# Altium project Camera-Controller-Board.PrjPcb (part 18 of 18)

## Sheet CCB-MB-Interface.SchDoc
size 420 x 297 mm; SheetNumber: 22; SheetTotal: 22
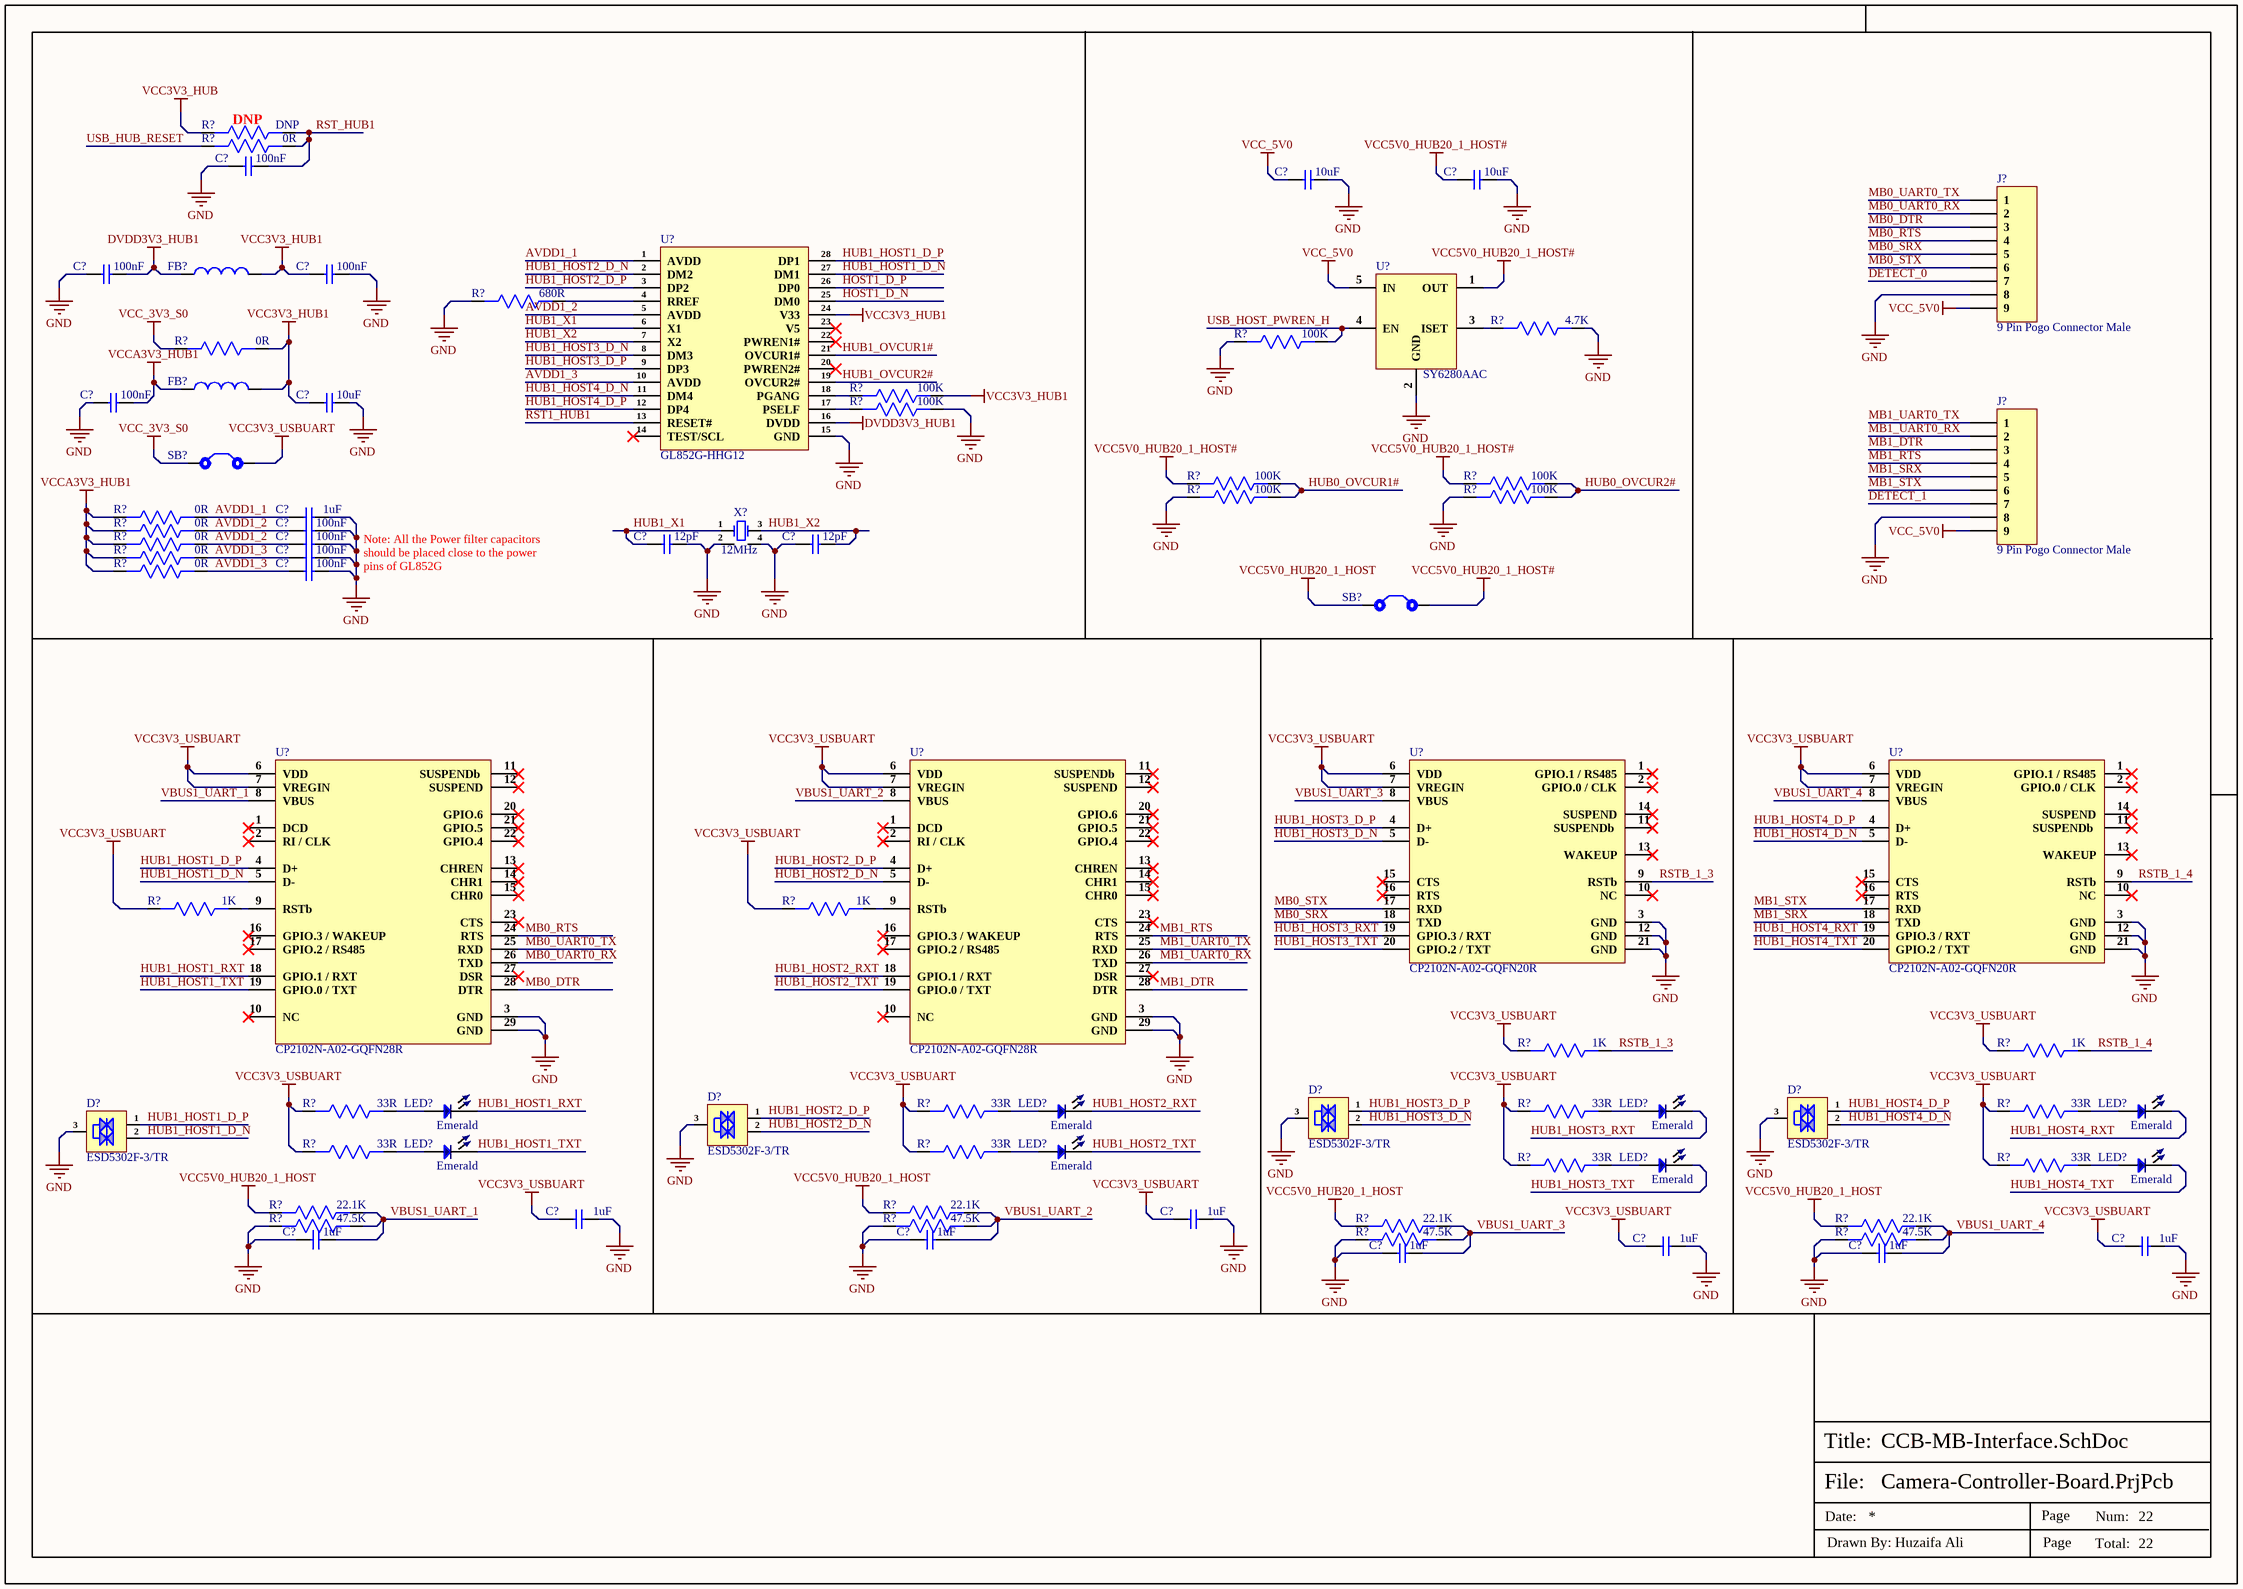
[diagram p21: CCB-MB-Interface.SchDoc]

### Parts
(Parts that share a designator on the sheet are numbered #1, #2 ... from top to bottom, then left to right.)
C?#27  100nF  [Cap-0402]
C?#28  10uF  [Cap-0603]
C?#29  10uF  [Cap-0603]
C?#30  100nF  [Cap-0402]
C?#31  100nF  [Cap-0402]
C?#32  100nF  [Cap-0402]
C?#33  10uF  [Cap-0603]
C?#34  1uF  [Cap-0603]
C?#35  100nF  [Cap-0402]
C?#36  100nF  [Cap-0402]
C?#37  12pF  [Cap-0402]
C?#38  12pF  [Cap-0402]
C?#39  100nF  [Cap-0402]
C?#40  100nF  [Cap-0402]
C?#41  1uF  [Cap-0603]
C?#42  1uF  [Cap-0603]
C?#43  1uF  [Cap-0603]
C?#44  1uF  [Cap-0603]
C?#45  1uF  [Cap-0603]
C?#46  1uF  [Cap-0603]
C?#47  1uF  [Cap-0603]
C?#48  1uF  [Cap-0603]
D?#10  ESD5302F-3/TR  [Sot-23]
D?#11  ESD5302F-3/TR  [Sot-23]
D?#12  ESD5302F-3/TR  [Sot-23]
D?#13  ESD5302F-3/TR  [Sot-23]
FB?#4  BLM15PD121SN1D  [IND-0402]  (value not drawn)
FB?#5  120R  [IND-0603 (1608 Metric)]  (value not drawn)
J?#4  9 Pin Pogo Connector Male  [MG0922M-RA]
J?#5  9 Pin Pogo Connector Male  [MG0922M-RA]
LED?#9  Emerald  [LED-0603]
LED?#10  Emerald  [LED-0603]
LED?#11  Emerald  [LED-0603]
LED?#12  Emerald  [LED-0603]
LED?#13  Emerald  [LED-0603]
LED?#14  Emerald  [LED-0603]
LED?#15  Emerald  [LED-0603]
LED?#16  Emerald  [LED-0603]
R?#41  DNP  [Res-0402]
R?#42  0R  [Res-0402]
R?#43  680R  [Res-0603]
R?#44  4.7K  [Res-0402]
R?#45  100K  [Res-0402]
R?#46  0R  [Res-0603]
R?#47  100K  [Res-0402]
R?#48  100K  [Res-0402]
R?#49  100K  [Res-0402]
R?#50  100K  [Res-0402]
R?#51  100K  [Res-0402]
R?#52  100K  [Res-0402]
R?#53  0R  [Res-0402]
R?#54  0R  [Res-0402]
R?#55  0R  [Res-0402]
R?#56  0R  [Res-0402]
R?#57  0R  [Res-0402]
R?#58  1K  [Res-0402]
R?#59  1K  [Res-0402]
R?#60  1K  [Res-0402]
R?#61  1K  [Res-0402]
R?#62  33R  [Res-0402]
R?#63  33R  [Res-0402]
R?#64  33R  [Res-0402]
R?#65  33R  [Res-0402]
R?#66  33R  [Res-0402]
R?#67  33R  [Res-0402]
R?#68  33R  [Res-0402]
R?#69  33R  [Res-0402]
R?#70  22.1K  [Res-0603]
R?#71  22.1K  [Res-0603]
R?#72  47.5K  [Res-0603]
R?#73  47.5K  [Res-0603]
R?#74  22.1K  [Res-0603]
R?#75  22.1K  [Res-0603]
R?#76  47.5K  [Res-0603]
R?#77  47.5K  [Res-0603]
SB?#12  Solder Bridge 0603  [Solder Bridge]  (value not drawn)
SB?#13  Solder Bridge 0603  [Solder Bridge]  (value not drawn)
U?#13  GL852G-HHG12  [SSOP-28-208mil]
U?#14  SY6280AAC  [SOT-23-5]
U?#15  CP2102N-A02-GQFN28R  [28-QFN (5x5)_]
U?#16  CP2102N-A02-GQFN28R  [28-QFN (5x5)_]
U?#17  CP2102N-A02-GQFN20R  [20-QFN (3x3)]
U?#18  CP2102N-A02-GQFN20R  [20-QFN (3x3)]
X?#2  12MHz  [X322512MOB4SI_]

### Nets
DVDD3V3_HUB1: C?#30.2 FB?#4.1 U?#13.16(DVDD)
GND: C?#27.1 C?#28.2 C?#29.2 C?#30.1 C?#31.2 C?#32.1 C?#33.2 C?#34.2 C?#35.2 C?#36.2 C?#37.2 C?#38.1 C?#39.2 C?#40.2 C?#41.2 C?#42.2 C?#43.1 C?#44.1 C?#45.2 C?#46.2 C?#47.1 C?#48.1 D?#10.3(GND) D?#11.3(GND) D?#12.3(GND) D?#13.3(GND) J?#4.8 J?#5.8 R?#43.2 R?#44.1 R?#45.2 R?#48.1 R?#51.2 R?#52.2 R?#72.2 R?#73.2 R?#76.2 R?#77.2 U?#13.15(GND) U?#14.2(GND) U?#15.3(GND) U?#15.29(GND) U?#16.3(GND) U?#16.29(GND) U?#17.3(GND) U?#17.12(GND) U?#17.21(GND) U?#18.3(GND) U?#18.12(GND) U?#18.21(GND) X?#2.2(GND) X?#2.4(GND)
VCC3V3_HUB: R?#41.2
VCC3V3_HUB1: C?#31.1 C?#33.1 FB?#4.2 FB?#5.2 R?#46.1 R?#47.1 U?#13.24(V33)
VCC3V3_USBUART: C?#41.1 C?#42.1 C?#45.1 C?#46.1 R?#58.2 R?#59.2 R?#60.2 R?#61.2 R?#62.2 R?#63.2 R?#64.2 R?#65.2 R?#66.2 R?#67.2 R?#68.2 R?#69.2 SB?#12.2 U?#15.6(VDD) U?#15.7(VREGIN) U?#16.6(VDD) U?#16.7(VREGIN) U?#17.6(VDD) U?#17.7(VREGIN) U?#18.6(VDD) U?#18.7(VREGIN)
VCC5V0_HUB20_1_HOST: R?#70.2 R?#71.2 R?#74.2 R?#75.2 SB?#13.1
VCC5V0_HUB20_1_HOST#: C?#29.1 R?#49.2 R?#50.2 SB?#13.2 U?#14.1(OUT)
VCC_3V3_S0: R?#46.2 SB?#12.1
VCC_5V0: C?#28.1 J?#4.9 J?#5.9 U?#14.5(IN)
VCCA3V3_HUB1: C?#32.2 FB?#5.1 R?#53.2 R?#54.2 R?#55.2 R?#56.2 R?#57.2
AVDD1_1: C?#34.1 R?#53.1 U?#13.1(AVDD)
AVDD1_2: C?#35.1 C?#36.1 R?#54.1 R?#55.1 U?#13.5(AVDD)
AVDD1_3: C?#39.1 C?#40.1 R?#56.1 R?#57.1 U?#13.10(AVDD)
DETECT_0: J?#4.7
DETECT_1: J?#5.7
HOST1_D_N: U?#13.25(DM0)
HOST1_D_P: U?#13.26(DP0)
HUB0_OVCUR1#: R?#49.1 R?#51.1
HUB0_OVCUR2#: R?#50.1 R?#52.1
HUB1_HOST1_D_N: D?#13.2(I/O2) U?#13.27(DM1) U?#15.5(D-)
HUB1_HOST1_D_P: D?#13.1(I/O1) U?#13.28(DP1) U?#15.4(D+)
HUB1_HOST1_RXT: LED?#9.2 U?#15.18(GPIO.1_/_RXT)
HUB1_HOST1_TXT: LED?#13.2 U?#15.19(GPIO.0_/_TXT)
HUB1_HOST2_D_N: D?#12.2(I/O2) U?#13.2(DM2) U?#16.5(D-)
HUB1_HOST2_D_P: D?#12.1(I/O1) U?#13.3(DP2) U?#16.4(D+)
HUB1_HOST2_RXT: LED?#10.2 U?#16.18(GPIO.1_/_RXT)
HUB1_HOST2_TXT: LED?#14.2 U?#16.19(GPIO.0_/_TXT)
HUB1_HOST3_D_N: D?#10.2(I/O2) U?#13.8(DM3) U?#17.5(D-)
HUB1_HOST3_D_P: D?#10.1(I/O1) U?#13.9(DP3) U?#17.4(D+)
HUB1_HOST3_RXT: LED?#11.2 U?#17.19(GPIO.3_/_RXT)
HUB1_HOST3_TXT: LED?#15.2 U?#17.20(GPIO.2_/_TXT)
HUB1_HOST4_D_N: D?#11.2(I/O2) U?#13.11(DM4) U?#18.5(D-)
HUB1_HOST4_D_P: D?#11.1(I/O1) U?#13.12(DP4) U?#18.4(D+)
HUB1_HOST4_RXT: LED?#12.2 U?#18.19(GPIO.3_/_RXT)
HUB1_HOST4_TXT: LED?#16.2 U?#18.20(GPIO.2_/_TXT)
HUB1_OVCUR1#: U?#13.21(OVCUR1#)
HUB1_OVCUR2#: U?#13.19(OVCUR2#)
HUB1_X1: C?#37.1 U?#13.6(X1) X?#2.1
HUB1_X2: C?#38.2 U?#13.7(X2) X?#2.3
MB0_DTR: J?#4.3 U?#15.28(DTR)
MB0_RTS: J?#4.4 U?#15.24(RTS)
MB0_SRX: J?#4.5 U?#17.18(TXD)
MB0_STX: J?#4.6 U?#17.17(RXD)
MB0_UART0_RX: J?#4.2 U?#15.26(TXD)
MB0_UART0_TX: J?#4.1 U?#15.25(RXD)
MB1_DTR: J?#5.3 U?#16.28(DTR)
MB1_RTS: J?#5.4 U?#16.24(RTS)
MB1_SRX: J?#5.5 U?#18.18(TXD)
MB1_STX: J?#5.6 U?#18.17(RXD)
MB1_UART0_RX: J?#5.2 U?#16.26(TXD)
MB1_UART0_TX: J?#5.1 U?#16.25(RXD)
RST1_HUB1: U?#13.13(RESET#)
RST_HUB1: C?#27.2 R?#41.1 R?#42.1
RSTB_1_3: R?#60.1 U?#17.9(RSTb)
RSTB_1_4: R?#61.1 U?#18.9(RSTb)
USB_HOST_PWREN_H: R?#45.1 U?#14.4(EN)
USB_HUB_RESET: R?#42.2
VBUS1_UART_1: C?#43.2 R?#70.1 R?#72.1 U?#15.8(VBUS)
VBUS1_UART_2: C?#44.2 R?#71.1 R?#73.1 U?#16.8(VBUS)
VBUS1_UART_3: C?#47.2 R?#74.1 R?#76.1 U?#17.8(VBUS)
VBUS1_UART_4: C?#48.2 R?#75.1 R?#77.1 U?#18.8(VBUS)
NetLED?#9_1: LED?#9.1 R?#62.1
NetLED?#10_1: LED?#10.1 R?#63.1
NetLED?#11_1: LED?#11.1 R?#64.1
NetLED?#12_1: LED?#12.1 R?#65.1
NetLED?#13_1: LED?#13.1 R?#66.1
NetLED?#14_1: LED?#14.1 R?#67.1
NetLED?#15_1: LED?#15.1 R?#68.1
NetLED?#16_1: LED?#16.1 R?#69.1
NetR?#43_1: R?#43.1 U?#13.4(RREF)
NetR?#44_2: R?#44.2 U?#14.3(ISET)
NetR?#47_2: R?#47.2 U?#13.18(PGANG)
NetR?#48_2: R?#48.2 U?#13.17(PSELF)
NetR?#58_1: R?#58.1 U?#15.9(RSTb)
NetR?#59_1: R?#59.1 U?#16.9(RSTb)

Not connected (* = marked no-connect by the designer): U?#13 14(TEST/SCL)* 20(PWREN2#)* 22(PWREN1#)* 23(V5)*; U?#15 1(DCD)* 2(RI_/_CLK)* 10(NC)* 11(SUSPENDb_)* 12(SUSPEND)* 13(CHREN)* 14(CHR1)* 15(CHR0)* 16(GPIO.3_/_WAKEUP)* 17(GPIO.2_/_RS485)* 20(GPIO.6)* 21(GPIO.5)* 22(GPIO.4)* 23(CTS)* 27(DSR)*; U?#16 1(DCD)* 2(RI_/_CLK)* 10(NC)* 11(SUSPENDb_)* 12(SUSPEND)* 13(CHREN)* 14(CHR1)* 15(CHR0)* 16(GPIO.3_/_WAKEUP)* 17(GPIO.2_/_RS485)* 20(GPIO.6)* 21(GPIO.5)* 22(GPIO.4)* 23(CTS)* 27(DSR)*; U?#17 1(GPIO.1_/_RS485)* 2(GPIO.0_/_CLK)* 10(NC)* 11(SUSPENDb_)* 13(WAKEUP)* 14(SUSPEND)* 15(CTS)* 16(RTS)*; U?#18 1(GPIO.1_/_RS485)* 2(GPIO.0_/_CLK)* 10(NC)* 11(SUSPENDb_)* 13(WAKEUP)* 14(SUSPEND)* 15(CTS)* 16(RTS)*

### Notes on the sheet
- (near R?#41) DNP
- (near C?#39) Note: All the Power filter capacitors should be placed close to the power pins of GL852G
- File:
- Title:
- Date:
- Page
- Num:
- Total:
- Drawn By: Huzaifa Ali

### Library data of the parts
C?#27 C?#30-C?#32 C?#35 C?#36 C?#39 C?#40 = CC0402KRX5R7BB104: as C?#23 on sheet ESP32-Sheet; Supplier 1: Mouser; Manufacturer Part Number: CC0402KRX5R7BB104; RoHS: Yes; Category: Ceramic Capacitors; Stock 1: 936792; Pricing 1: 1=0.10000, 10=0.02300, 50=0.02300, 100=0.01100, 1000=0.00600, 10000=0.00400 (USD); Mount: Surface Mount; Case/Package: 0402; Number of Pins: 2; Case Code (Metric): 1005; Case Code (Imperial): 0402; Min Operating Temperature: -55°C; Max Operating Temperature: 85°C; Capacitance: 100nF; Dielectric: X5R; Packaging: Tape and Reel; Voltage Rating: 16V; Package Quantity: 1; Voltage Rating (DC): 16V; Termination: SMD/SMT; Resistor Type: Ceramic; Series: CC; Construction: Flat; Length: 1mm; Width: 0.02inch; Height: 0.5mm; Thickness: 0.022inch; Depth: 0.5mm; Radiation Hardening: No; REACH SVHC: Unknown; Lead Free: Lead Free; Halogen Free: Halogen Free; RoHS Compliant: Yes; ComponentLink1URL: https://datasheet.ciiva.com/155/mlccorderingcode-155879.pdf?src-supplier=Digi-Key; ComponentLink1Description: https://datasheet.ciiva.com/155/mlccorderingcode-155879.pdf?src-supplier=Digi-Key; ComponentLink2URL: https://datasheet.ciiva.com/155/mlccorderingcode-155878.pdf?src-supplier=Digi-Key; ComponentLink2Description: https://datasheet.ciiva.com/155/mlccorderingcode-155878.pdf?src-supplier=Digi-Key; ComponentLink3URL: https://datasheet.ciiva.com/155/mlccorderingcode-155880.pdf?src-supplier=Digi-Key; ComponentLink3Description: https://datasheet.ciiva.com/155/mlccorderingcode-155880.pdf?src-supplier=Digi-Key; ComponentLink4URL: https://datasheet.ciiva.com/11464/upy-gphc-x5r-4v-to-50v-12-11464869.pdf?src-supplier=Avnet; ComponentLink4Description: https://datasheet.ciiva.com/11464/upy-gphc-x5r-4v-to-50v-12-11464869.pdf?src-supplier=Avnet; Supplier Part Number 1: 603-CC402KRX5R7BB104; LCSC Part Number: C106204
C?#28 C?#29 C?#33 = CC0603KRX5R6BB106: as C?#24 on sheet ESP32-Sheet; Supplier 1: Digi-Key; Manufacturer Part Number: CC0603KRX5R6BB106; RoHS: Yes; Category: Ceramic Capacitors; Stock 1: 187515; Pricing 1: 1=0.24000, 10=0.16300, 50=0.09780, 100=0.08260, 500=0.05654, 1000=0.05001 (USD); Mount: Surface Mount; Case/Package: 0603; Case Code (Metric): 1608; Case Code (Imperial): 0603; Weight: 7.1E-05oz; Min Operating Temperature: -55°C; Max Operating Temperature: 85°C; Capacitance: 10uF; Packaging: Tape and Reel; Dielectric: X5R; Voltage Rating: 10V; Termination: SMD/SMT; Resistor Type: Ceramic; Voltage Rating (DC): 10V; Package Quantity: 4000; Length: 0.063inch; Width: 0.031inch; Thickness: 0.035inch; Depth: 0.8mm; Lead Free: Lead Free; Halogen Free: Halogen Free; RoHS Compliant: Yes; ComponentLink1URL: http://www.mouser.com/ds/2/447/Yageo_UPY-GP_NP0_16V-to-50V_9-358835.pdf?src-supplier=Mouser; ComponentLink1Description: http://www.mouser.com/ds/2/447/Yageo_UPY-GP_NP0_16V-to-50V_9-358835.pdf?src-supplier=Mouser; ComponentLink2URL: http://www.yageo.com/documents/recent/UPY-GPHC_X5R_4V-to-50V_25.pdf?src-supplier=Digi-Key; ComponentLink2Description: http://www.yageo.com/documents/recent/UPY-GPHC_X5R_4V-to-50V_25.pdf?src-supplier=Digi-Key; Supplier Part Number 1: 311-1782-1-ND; LCSC Part Number: C326057
C?#34 C?#41-C?#48 = CC0603KRX5R8BB105: as C?#25 on sheet ESP32-Sheet; Supplier 1: Digi-Key; Manufacturer Part Number: CC0603KRX5R8BB105; RoHS: Yes; Category: Ceramic Capacitors; Stock 1: 919939; Pricing 1: 1=0.12000, 10=0.08400, 50=0.04760, 100=0.03940, 500=0.02764, 1000=0.02288 (USD); Mount: Surface Mount; Case/Package: 0603; Number of Pins: 2; Case Code (Metric): 1608; Case Code (Imperial): 0603; Min Operating Temperature: -55°C; Max Operating Temperature: 85°C; Capacitance: 1uF; Dielectric: X5R; Package Quantity: 1; Voltage Rating: 25V; Packaging: Tape and Reel; Termination: SMD/SMT; Voltage Rating (DC): 25V; Series: CC; Construction: Flat; Length: 1.6mm; Width: 0.031inch; Height: 0.8mm; Thickness: 0.035inch; Depth: 0.8mm; Radiation Hardening: No; REACH SVHC: No SVHC; Lead Free: Lead Free; Halogen Free: Halogen Free; RoHS Compliant: Yes; ComponentLink1URL: https://datasheet.ciiva.com/176/mlccorderingcode-176785.pdf?src-supplier=Digi-Key; ComponentLink1Description: https://datasheet.ciiva.com/176/mlccorderingcode-176785.pdf?src-supplier=Digi-Key; ComponentLink2URL: https://datasheet.ciiva.com/176/mlccorderingcode-176786.pdf?src-supplier=Digi-Key; ComponentLink2Description: https://datasheet.ciiva.com/176/mlccorderingcode-176786.pdf?src-supplier=Digi-Key; ComponentLink3URL: https://datasheet.ciiva.com/176/mlccorderingcode-176787.pdf?src-supplier=Digi-Key; ComponentLink3Description: https://datasheet.ciiva.com/176/mlccorderingcode-176787.pdf?src-supplier=Digi-Key; ComponentLink4URL: https://datasheet.ciiva.com/17436/upy-gphc-x5r-4v-to-50v-12-17436952.pdf?src-supplier=Avnet+Europe; ComponentLink4Description: https://datasheet.ciiva.com/17436/upy-gphc-x5r-4v-to-50v-12-17436952.pdf?src-supplier=Avnet+Europe; ComponentLink5URL: https://datasheet.ciiva.com/7978/1525783-7978171.pdf?src-supplier=Element14; ComponentLink5Description: https://datasheet.ciiva.com/7978/1525783-7978171.pdf?src-supplier=Element14; ComponentLink6URL: https://datasheet.ciiva.com/11586/upy-gphc-x5r-4v-to-50v-12-11586318.pdf?src-supplier=Avnet; ComponentLink6Description: https://datasheet.ciiva.com/11586/upy-gphc-x5r-4v-to-50v-12-11586318.pdf?src-supplier=Avnet; Supplier Part Number 1: 311-1445-1-ND; LCSC Part Number: C14664
C?#37 C?#38 = GJM1555C1H120GB01D: CAP CER 12PF 50V C0G/NP0 0402; Manufacturer: Murata; Tolerance: 2%; Dielectric: C0G; Supplier 1: Digi-Key; Manufacturer Part Number: GJM1555C1H120GB01D; RoHS: Yes; Category: Ceramic Capacitors; Stock 1: 266975; Pricing 1: 1=0.18000, 10=0.12600, 50=0.07560, 100=0.06390, 500=0.04370, 1000=0.03865, 2500=0.03698, 5000=0.03361 (USD); Mount: Surface Mount; Case/Package: 0402; Case Code (Imperial): 0402; Case Code (Metric): 1005; Min Operating Temperature: -55°C; Max Operating Temperature: 125°C; Capacitance: 12pF; Voltage Rating: 50V; Voltage Rating (DC): 50V; Packaging: Tape and Reel; Package Quantity: 10000; Termination: SMD/SMT; Series: GJM; Construction: Flat; Length: 1mm; Width: 0.5mm; Height: 0.5mm; Thickness: 0.022inch; Depth: 0.5mm; Radiation Hardening: No; Lead Free: Lead Free; RoHS Compliant: Yes; ComponentLink1URL: https://datasheet.ciiva.com/11608/product-11608208.pdf?src-supplier=Avnet; ComponentLink1Description: https://datasheet.ciiva.com/11608/product-11608208.pdf?src-supplier=Avnet; ComponentLink2URL: https://datasheet.ciiva.com/29542/partnumbering-e-01-29542716.pdf?src-supplier=Digi-Key; ComponentLink2Description: https://datasheet.ciiva.com/29542/partnumbering-e-01-29542716.pdf?src-supplier=Digi-Key; ComponentLink3URL: https://datasheet.ciiva.com/29542/partnumbering-e-01-29542715.pdf?src-supplier=Digi-Key; ComponentLink3Description: https://datasheet.ciiva.com/29542/partnumbering-e-01-29542715.pdf?src-supplier=Digi-Key; ComponentLink4URL: https://datasheet.ciiva.com/29542/partnumbering-e-01-29542717.pdf?src-supplier=Digi-Key; ComponentLink4Description: https://datasheet.ciiva.com/29542/partnumbering-e-01-29542717.pdf?src-supplier=Digi-Key; Supplier Part Number 1: 490-8078-1-ND; LCSC Part Number: C161305
D?#10-D?#13 = ESD5302F-3/TR: 16A 20V 7V 5V@Max Unidirectional SOT-23 TVS ROHS; Manufacturer: WILLSEMI; Item Type: Diode; Manufacturer Part Number: ESD5302F-3/TR; Package: SOT-23; LCSC Part Number: C239643; ComponentLink1Description: LCSC; ComponentLink1URL: https://www.lcsc.com/product-detail/TVS_WILLSEMI-Will-Semicon-ESD5302F-3-TR_C239643.html
FB?#4 = BLM15PD121SN1D: FERRITE BEAD 120 OHM 0402 1LN; Manufacturer: Murata; Material: Steel,Ferrite; Tolerance: 25%; Impedance: 120R; Current Rating: 1.3A; Number of Lines: 1; DC Resistance (DCR): 90mR; Test Frequency: 100MHz; Supplier 1: Avnet; Manufacturer Part Number: BLM15PD121SN1D; RoHS: Yes; Category: Ferrite Beads and Chips; Stock 1: 300000; Pricing 1: 10000=0.03238, 20000=0.03063, 40000=0.02888, 60000=0.02713, 80000=0.02538, 100000=0.02363, 1000000=0.02188 (USD); Case/Package: 0402; Number of Pins: 2; Core Material: Ferrite; Case Code (Metric): 1005; Case Code (Imperial): 0402; Min Operating Temperature: -55°C; Max Operating Temperature: 125°C; Package Quantity: 1; Packaging: Tape and Reel; Max Current Rating: 1.3A; Termination: SMD/SMT; Max DC Current: 1.3A; DC Current: 1.3A; Number of Circuits: 1; Series: BLM15PD; DC Resistance-Max: 90mR; Length: 1mm; Width: 0.5mm; Height: 0.5mm; Depth: 0.55mm; Radiation Hardening: No; Reach SVHC Compliant: Yes; Military Standard: Not; Lead Free: Lead Free; RoHS Compliant: Yes; ComponentLink1URL: https://datasheet.ciiva.com/11800/0900766b811b5866-11800860.pdf?src-supplier=RSComponents; ComponentLink1Description: https://datasheet.ciiva.com/11800/0900766b811b5866-11800860.pdf?src-supplier=RSComponents; ComponentLink2URL: https://datasheet.ciiva.com/18093/getdatasheetpartid-195858-18093157.pdf?src-supplier=Verical; ComponentLink2Description: https://datasheet.ciiva.com/18093/getdatasheetpartid-195858-18093157.pdf?src-supplier=Verical; ComponentLink3URL: https://datasheet.ciiva.com/41425/001171686-da-01-en-chip-drossel0402-120r-1300ma-1-0x0-5mm-41425776.pdf?src-supplier=Conrad; ComponentLink3Description: https://datasheet.ciiva.com/41425/001171686-da-01-en-chip-drossel0402-120r-1300ma-1-0x0-5mm-41425776.pdf?src-supplier=Conrad; ComponentLink4URL: https://datasheet.ciiva.com/41449/001172205-da-01-en-drossel-0402-120r-11-0x0-5mm-10000st-41449495.pdf?src-supplier=Conrad; ComponentLink4Description: https://datasheet.ciiva.com/41449/001172205-da-01-en-drossel-0402-120r-11-0x0-5mm-10000st-41449495.pdf?src-supplier=Conrad; ComponentLink5URL: https://datasheet.ciiva.com/1012/l0110e-1012435.pdf?src-supplier=Digi-Key; ComponentLink5Description: https://datasheet.ciiva.com/1012/l0110e-1012435.pdf?src-supplier=Digi-Key; ComponentLink6URL: https://datasheet.ciiva.com/1012/l0110e-1012434.pdf?src-supplier=Digi-Key; ComponentLink6Description: https://datasheet.ciiva.com/1012/l0110e-1012434.pdf?src-supplier=Digi-Key; ComponentLink7URL: https://datasheet.ciiva.com/1012/l0110e-1012436.pdf?src-supplier=Digi-Key; ComponentLink7Description: https://datasheet.ciiva.com/1012/l0110e-1012436.pdf?src-supplier=Digi-Key; Supplier Part Number 1: BLM15PD121SN1D; LCSC Part Number: C76891; Item Type: Ferrite Bead
FB?#5 = BLM18KG121TZ1D: as FB?#3 on sheet ESP32-Sheet; Supplier 1: Arrow Electronics; Manufacturer Part Number: BLM18KG121TZ1D; RoHS: Yes; Category: Ferrite Beads and Chips; Stock 1: 4000; Pricing 1: 1=0.10530, 10=0.06110, 25=0.04800, 100=0.04700, 250=0.03740, 500=0.03700, 1000=0.03470, 3000=0.03130 (USD); Mount: Surface Mount; Case/Package: 0603; Case Code (Imperial): 0603; Case Code (Metric): 1608; Min Operating Temperature: -55°C; Max Operating Temperature: 125°C; Packaging: Tape and Reel; Ratings: AEC-Q200; RoHS Compliant: Yes; ComponentLink1URL: https://www.murata.com/en-us/products/productdata/8796750610462/QNFA9122.pdf?src-supplier=Digi-Key; ComponentLink1Description: https://www.murata.com/en-us/products/productdata/8796750610462/QNFA9122.pdf?src-supplier=Digi-Key; ComponentLink2URL: https://www.murata.com/en-us/products/productdata/8796733866014/S0594E.pdf?src-supplier=Digi-Key; ComponentLink2Description: https://www.murata.com/en-us/products/productdata/8796733866014/S0594E.pdf?src-supplier=Digi-Key; Supplier Part Number 1: BLM18KG121TZ1D; LCSC Part Number: C396652; Item Type: Ferrite Bead
J?#4 J?#5 = 9 Pin Pogo Connector Male: 3A Magnetic Pogo Pin Connector 9 pin; Manufacturer: RTLECS; Manufacturer Part Number: MG0922M-RA; Package: Custom; ComponentLink1Description: ALiexpress; ComponentLink1URL: https://vi.aliexpress.com/item/1005002669709542.html
LED?#9-LED?#16 = NCD0603G2: Emerald 0603 Light Emitting Diodes (LED) ROHS; Manufacturer: Foshan NationStar Optoelectronics; Manufacturer Part Number: NCD0603G2; Package: 0603; LCSC Part Number: C87326; Item Type: LED; ComponentLink1Description: LCSC; ComponentLink1URL: https://www.lcsc.com/product-detail/Light-Emitting-Diodes-LED_Foshan-NationStar-Optoelectronics-NCD0603G2_C87326.html
R?#41 = RC0402FR-0710KL: as R?#37 on sheet ESP32-Sheet; Supplier 1: Mouser; Manufacturer Part Number: RC0402FR-0710KL; RoHS: Yes; Category: Chip SMD Resistors; Stock 1: 18648329; Pricing 1: 1=0.10000, 10=0.01400, 50=0.01400, 100=0.00500, 1000=0.00300, 10000=0.00200 (USD); Case/Package: 0402; Number of Pins: 2; Case Code (Imperial): 0402; Case Code (Metric): 1005; Min Operating Temperature: -55°C; Max Operating Temperature: 155°C; Resistor Type: Thick Film; Tolerance: 1%; Packaging: Tape and Reel; Voltage Rating: 50V; Termination: SMD/SMT; Working Voltage: 50V; Number of Terminations: 2; Features: Moisture Resistant; Series: RC; Resistance Tolerance: 1%; Construction: Rectangular; Length: 1mm; Width: 0.5mm; Height: 0.32mm; Depth: 0.5mm; Lead Pitch: 0.2mm; REACH SVHC: No SVHC; Lead Free: Lead Free; RoHS Compliant: Yes; Military Standard: Not; ComponentLink1URL: https://datasheet.ciiva.com/7660/38568-7660787.pdf?src-supplier=Element14; ComponentLink1Description: https://datasheet.ciiva.com/7660/38568-7660787.pdf?src-supplier=Element14; ComponentLink2URL: https://datasheet.ciiva.com/7849/1686128-7849814.pdf?src-supplier=Element14; ComponentLink2Description: https://datasheet.ciiva.com/7849/1686128-7849814.pdf?src-supplier=Element14; ComponentLink3URL: https://datasheet.ciiva.com/7983/1018594-7983486.pdf?src-supplier=Element14; ComponentLink3Description: https://datasheet.ciiva.com/7983/1018594-7983486.pdf?src-supplier=Element14; ComponentLink4URL: https://datasheet.ciiva.com/22747/1018594-22747512.pdf?src-supplier=Element14; ComponentLink4Description: https://datasheet.ciiva.com/22747/1018594-22747512.pdf?src-supplier=Element14; ComponentLink5URL: https://datasheet.ciiva.com/12667/pyu-rc0402-51-rohs-l-6-r-12667067.pdf?src-supplier=Mouser; ComponentLink5Description: https://datasheet.ciiva.com/12667/pyu-rc0402-51-rohs-l-6-r-12667067.pdf?src-supplier=Mouser; ComponentLink6URL: https://datasheet.ciiva.com/7849/1784430-7849813.pdf?src-supplier=Element14; ComponentLink6Description: https://datasheet.ciiva.com/7849/1784430-7849813.pdf?src-supplier=Element14; ComponentLink7URL: https://datasheet.ciiva.com/7849/1784430-7849815.pdf?src-supplier=Element14; ComponentLink7Description: https://datasheet.ciiva.com/7849/1784430-7849815.pdf?src-supplier=Element14; Supplier Part Number 1: 603-RC0402FR-0710KL; LCSC Part Number: C60490
R?#42 R?#53-R?#57 = RC0402FR-070RL: as R217-R222 on sheet WiFi-Section; Supplier 1: Mouser; Manufacturer Part Number: RC0402FR-070RL; RoHS: Yes; Category: Chip SMD Resistors; Stock 1: 8556842; Pricing 1: 1=0.10000, 10=0.01400, 50=0.01400, 100=0.00600, 1000=0.00300, 5000=0.00200, 10000=0.00100 (USD); Mount: Surface Mount; Case/Package: 0402; Contact Plating: Tin,Matte; Case Code (Imperial): 0402; Case Code (Metric): 1005; Size Code: 0402; Min Operating Temperature: -55°C; Max Operating Temperature: 155°C; Resistance: 0R; Resistor Type: Thick Film; Packaging: Tape and Reel; Termination: SMD/SMT; Features: Moisture Resistant; Series: RC; Number of Terminations: 2; Length: 1mm; Width: 0.5mm; Height: 0.35mm; Radiation Hardening: No; Lead Free: Lead Free; RoHS Compliant: Yes; ComponentLink1URL: https://datasheet.ciiva.com/8896/pyu-rc0402-51-rohs-l-6-8896149.pdf?src-supplier=Avnet; ComponentLink1Description: https://datasheet.ciiva.com/8896/pyu-rc0402-51-rohs-l-6-8896149.pdf?src-supplier=Avnet; ComponentLink2URL: https://datasheet.ciiva.com/16790/pyu-rc0402-51-rohs-l-6-r-16790444.pdf?src-supplier=Future+Electronics; ComponentLink2Description: https://datasheet.ciiva.com/16790/pyu-rc0402-51-rohs-l-6-r-16790444.pdf?src-supplier=Future+Electronics; Supplier Part Number 1: 603-RC0402FR-070RL; LCSC Part Number: C106231
R?#43 = RC0603FR-07680RL: RES SMD 680 OHM 1% 1/10W 0603; Manufacturer: Yageo; Item Type: Resistor; Manufacturer Part Number: RC0603FR-07680RL; Package: 0603; ComponentLink4URL: https://www.lcsc.com/product-detail/Chip-Resistor-Surface-Mount_YAGEO-RC0603FR-07680RL_C112310.html; ComponentLink4Description: LCSC; LCSC Part Number: C112310
R?#44 = RC0402FR-074K7L: RES 4.7K OHM 1% 1/16W 0402; Manufacturer: Yageo; Voltage Rating (DC): 50V; Power Rating: 62.5mW; Resistance: 4.7kR; Temperature Coefficient: 100ppm/°C; Max Power Dissipation: 63mW; Item Type: Resistor; Supplier 1: Avnet; Manufacturer Part Number: RC0402FR-074K7L; RoHS: Yes; Category: Chip SMD Resistors; Stock 1: 2420000; Pricing 1: 10000=0.00085 (USD); Case/Package: 0402; Number of Pins: 2; Case Code (Imperial): 0402; Case Code (Metric): 1005; Size Code: 0402; Min Operating Temperature: -55°C; Max Operating Temperature: 155°C; Tolerance: 1%; Voltage Rating: 50V; Packaging: Tape and Reel; Resistor Type: Thick Film; Termination: SMD/SMT; Features: Moisture Resistant; Series: RC; Number of Terminations: 2; Resistance Tolerance: 1%; Construction: Rectangular; Length: 1mm; Width: 0.5mm; Height: 0.32mm; Depth: 0.5mm; Height - Seated (Max): 0.016inch; RoHS Compliant: Yes; Reach SVHC Compliant: Yes; Military Standard: Not; Lead Free: Lead Free; ComponentLink1URL: https://datasheet.ciiva.com/22661/1686128-22661342.pdf?src-supplier=Element14; ComponentLink1Description: https://datasheet.ciiva.com/22661/1686128-22661342.pdf?src-supplier=Element14; ComponentLink2URL: https://datasheet.ciiva.com/7850/1018594-7850022.pdf?src-supplier=Element14; ComponentLink2Description: https://datasheet.ciiva.com/7850/1018594-7850022.pdf?src-supplier=Element14; ComponentLink3URL: https://datasheet.ciiva.com/7850/1018594-7850023.pdf?src-supplier=Element14; ComponentLink3Description: https://datasheet.ciiva.com/7850/1018594-7850023.pdf?src-supplier=Element14; ComponentLink4URL: https://datasheet.ciiva.com/15215/getdatasheetpartid-328119-15215035.pdf?src-supplier=Verical; ComponentLink4Description: https://datasheet.ciiva.com/15215/getdatasheetpartid-328119-15215035.pdf?src-supplier=Verical; Supplier Part Number 1: RC0402FR-074K7L; LCSC Part Number: C105871
R?#45 R?#49-R?#52 = RC0402FR-07100KL: RES 100K OHM 1% 1/16W 0402; Manufacturer: Yageo; Resistance: 100kR; Temperature Coefficient: 100ppm/°C; Power Rating: 63mW; Voltage Rating: 50V; Item Type: Resistor; Supplier 1: Mouser; Manufacturer Part Number: RC0402FR-07100KL; RoHS: Yes; Category: Chip SMD Resistors; Stock 1: 7759549; Pricing 1: 1=0.10000, 10=0.01200, 50=0.01200, 100=0.00500, 1000=0.00300, 2500=0.00200, 10000=0.00100 (USD); Case/Package: 0402; Case Code (Metric): 1005; Case Code (Imperial): 0402; Min Operating Temperature: -55°C; Max Operating Temperature: 155°C; Resistor Type: Thick Film; Tolerance: 1%; Packaging: Tape and Reel; Package Quantity: 1; Number of Terminations: 2; Termination: SMD/SMT; Max Power Dissipation: 63mW; Working Voltage: 50V; Features: Moisture Resistant; Series: RC; Resistance Tolerance: 1%; Construction: Rectangular; Technology: THICK FILM; Length: 0.039inch; Width: 0.02inch; Height: 0.016inch; Depth: 0.5mm; REACH SVHC: No SVHC; Lead Free: Lead Free; RoHS Compliant: Yes; Military Standard: Not; ComponentLink1URL: https://datasheet.ciiva.com/11819/0900766b80c66297-11819452.pdf?src-supplier=RSComponents; ComponentLink1Description: https://datasheet.ciiva.com/11819/0900766b80c66297-11819452.pdf?src-supplier=RSComponents; ComponentLink2URL: https://datasheet.ciiva.com/22747/1018594-22747509.pdf?src-supplier=Element14; ComponentLink2Description: https://datasheet.ciiva.com/22747/1018594-22747509.pdf?src-supplier=Element14; ComponentLink3URL: https://datasheet.ciiva.com/2453/pyu-r-int-thick-7-2453362.pdf?src-supplier=Digi-Key; ComponentLink3Description: https://datasheet.ciiva.com/2453/pyu-r-int-thick-7-2453362.pdf?src-supplier=Digi-Key; ComponentLink4URL: https://datasheet.ciiva.com/2453/pyu-r-int-thick-7-2453363.pdf?src-supplier=Digi-Key; ComponentLink4Description: https://datasheet.ciiva.com/2453/pyu-r-int-thick-7-2453363.pdf?src-supplier=Digi-Key; ComponentLink5URL: https://datasheet.ciiva.com/2453/pyu-r-int-thick-7-2453361.pdf?src-supplier=Digi-Key; ComponentLink5Description: https://datasheet.ciiva.com/2453/pyu-r-int-thick-7-2453361.pdf?src-supplier=Digi-Key; ComponentLink6URL: https://datasheet.ciiva.com/12667/pyu-rc0402-51-rohs-l-6-r-12667930.pdf?src-supplier=Mouser; ComponentLink6Description: https://datasheet.ciiva.com/12667/pyu-rc0402-51-rohs-l-6-r-12667930.pdf?src-supplier=Mouser; ComponentLink7URL: https://datasheet.ciiva.com/15189/getdatasheetpartid-323696-15189334.pdf?src-supplier=Verical; ComponentLink7Description: https://datasheet.ciiva.com/15189/getdatasheetpartid-323696-15189334.pdf?src-supplier=Verical; Supplier Part Number 1: 603-RC0402FR-07100KL; LCSC Part Number: C60491
R?#46 = RC0603FR-070RL: as R?#36 on sheet ESP32-Sheet; Manufacturer Part Number: RC0603FR-070RL; Package: 0603; LCSC Part Number: C100044; ComponentLink9Description: LCSC; ComponentLink9URL: https://www.lcsc.com/product-detail/Chip-Resistor-Surface-Mount_YAGEO-RC0603FR-070RL_C100044.html
R?#47 R?#48 = RC0402FR-07100KL: as R224 on sheet WiFi-Section; Supplier 1: Mouser; Manufacturer Part Number: RC0402FR-07100KL; RoHS: Yes; Category: Chip SMD Resistors; Stock 1: 7759549; Pricing 1: 1=0.10000, 10=0.01200, 50=0.01200, 100=0.00500, 1000=0.00300, 2500=0.00200, 10000=0.00100 (USD); Case/Package: 0402; Case Code (Metric): 1005; Case Code (Imperial): 0402; Min Operating Temperature: -55°C; Max Operating Temperature: 155°C; Resistor Type: Thick Film; Tolerance: 1%; Packaging: Tape and Reel; Package Quantity: 1; Number of Terminations: 2; Termination: SMD/SMT; Max Power Dissipation: 63mW; Working Voltage: 50V; Features: Moisture Resistant; Series: RC; Resistance Tolerance: 1%; Construction: Rectangular; Technology: THICK FILM; Length: 0.039inch; Width: 0.02inch; Height: 0.016inch; Depth: 0.5mm; REACH SVHC: No SVHC; Lead Free: Lead Free; RoHS Compliant: Yes; Military Standard: Not; ComponentLink1URL: https://datasheet.ciiva.com/11819/0900766b80c66297-11819452.pdf?src-supplier=RSComponents; ComponentLink1Description: https://datasheet.ciiva.com/11819/0900766b80c66297-11819452.pdf?src-supplier=RSComponents; ComponentLink2URL: https://datasheet.ciiva.com/22747/1018594-22747509.pdf?src-supplier=Element14; ComponentLink2Description: https://datasheet.ciiva.com/22747/1018594-22747509.pdf?src-supplier=Element14; ComponentLink3URL: https://datasheet.ciiva.com/2453/pyu-r-int-thick-7-2453362.pdf?src-supplier=Digi-Key; ComponentLink3Description: https://datasheet.ciiva.com/2453/pyu-r-int-thick-7-2453362.pdf?src-supplier=Digi-Key; ComponentLink4URL: https://datasheet.ciiva.com/2453/pyu-r-int-thick-7-2453363.pdf?src-supplier=Digi-Key; ComponentLink4Description: https://datasheet.ciiva.com/2453/pyu-r-int-thick-7-2453363.pdf?src-supplier=Digi-Key; ComponentLink5URL: https://datasheet.ciiva.com/2453/pyu-r-int-thick-7-2453361.pdf?src-supplier=Digi-Key; ComponentLink5Description: https://datasheet.ciiva.com/2453/pyu-r-int-thick-7-2453361.pdf?src-supplier=Digi-Key; ComponentLink6URL: https://datasheet.ciiva.com/12667/pyu-rc0402-51-rohs-l-6-r-12667930.pdf?src-supplier=Mouser; ComponentLink6Description: https://datasheet.ciiva.com/12667/pyu-rc0402-51-rohs-l-6-r-12667930.pdf?src-supplier=Mouser; ComponentLink7URL: https://datasheet.ciiva.com/15189/getdatasheetpartid-323696-15189334.pdf?src-supplier=Verical; ComponentLink7Description: https://datasheet.ciiva.com/15189/getdatasheetpartid-323696-15189334.pdf?src-supplier=Verical; Supplier Part Number 1: 603-RC0402FR-07100KL
R?#58-R?#61 = RC0402FR-071KL: RES 1K OHM 1% 1/16W 0402; Manufacturer: Yageo; Resistance: 1kR; Temperature Coefficient: 100ppm/°C; Voltage Rating (DC): 50V; Power Rating: 62.5mW; Max Power Dissipation: 63mW; Item Type: Resistor; Supplier 1: Avnet; Manufacturer Part Number: RC0402FR-071KL; RoHS: Yes; Category: Chip SMD Resistors; Stock 1: 13030000; Pricing 1: 10000=0.00085, 20000=0.00087, 40000=0.00084, 60000=0.00083, 80000=0.00079, 100000=0.00078, 1000000=0.00076 (USD); Case/Package: 0402; Number of Pins: 2; Case Code (Imperial): 0402; Case Code (Metric): 1005; Size Code: 0402; Min Operating Temperature: -55°C; Max Operating Temperature: 155°C; Resistor Type: Thick Film; Tolerance: 1%; Packaging: Tape and Reel; Voltage Rating: 50V; Termination: SMD/SMT; Features: Moisture Resistant; Series: RC; Number of Terminations: 2; Resistance Tolerance: 1%; Construction: Rectangular; Technology: THICK FILM; Length: 1mm; Width: 0.5mm; Height: 0.32mm; Depth: 0.5mm; Reach SVHC Compliant: Yes; Lead Free: Lead Free; RoHS Compliant: Yes; Military Standard: Not; ComponentLink1URL: https://datasheet.ciiva.com/11819/0900766b80c66297-11819477.pdf?src-supplier=RSComponents; ComponentLink1Description: https://datasheet.ciiva.com/11819/0900766b80c66297-11819477.pdf?src-supplier=RSComponents; ComponentLink2URL: https://datasheet.ciiva.com/7983/1018594-7983502.pdf?src-supplier=Element14; ComponentLink2Description: https://datasheet.ciiva.com/7983/1018594-7983502.pdf?src-supplier=Element14; ComponentLink3URL: https://datasheet.ciiva.com/22747/1018594-22747513.pdf?src-supplier=Element14; ComponentLink3Description: https://datasheet.ciiva.com/22747/1018594-22747513.pdf?src-supplier=Element14; ComponentLink4URL: https://datasheet.ciiva.com/12666/pyu-rc0402-51-rohs-l-6-r-12666741.pdf?src-supplier=Mouser; ComponentLink4Description: https://datasheet.ciiva.com/12666/pyu-rc0402-51-rohs-l-6-r-12666741.pdf?src-supplier=Mouser; ComponentLink5URL: https://datasheet.ciiva.com/7849/1018594-7849869.pdf?src-supplier=Element14; ComponentLink5Description: https://datasheet.ciiva.com/7849/1018594-7849869.pdf?src-supplier=Element14; ComponentLink6URL: https://datasheet.ciiva.com/7849/1018594-7849871.pdf?src-supplier=Element14; ComponentLink6Description: https://datasheet.ciiva.com/7849/1018594-7849871.pdf?src-supplier=Element14; ComponentLink7URL: https://datasheet.ciiva.com/17063/pyu-rc0402-51-rohs-l-6-r-17063193.pdf?src-supplier=Future+Electronics; ComponentLink7Description: https://datasheet.ciiva.com/17063/pyu-rc0402-51-rohs-l-6-r-17063193.pdf?src-supplier=Future+Electronics; Supplier Part Number 1: RC0402FR-071KL; LCSC Part Number: C106235
R?#62-R?#69 = RC0402FR-0733RL: RES 33 OHM 1% 1/16W 0402; Manufacturer: Yageo; Power Rating: 62.5mW; Voltage Rating: 50V; Temperature Coefficient: 100ppm/°C; Max Power Dissipation: 63mW; Supplier 1: Mouser; Manufacturer Part Number: RC0402FR-0733RL; RoHS: Yes; Category: Chip SMD Resistors; Stock 1: 1843488; Pricing 1: 1=0.10000, 10=0.01200, 50=0.01200, 100=0.00500, 1000=0.00300, 10000=0.00100 (USD); Case/Package: 0402; Number of Pins: 2; Case Code (Imperial): 0402; Case Code (Metric): 1005; Size Code: 0402; Min Operating Temperature: -55°C; Max Operating Temperature: 155°C; Resistor Type: Thick Film; Resistance: 33R; Tolerance: 1%; Packaging: Tape and Reel; Voltage Rating (DC): 50V; Package Quantity: 10000; Termination: SMD/SMT; Features: Moisture Resistant; Series: RC; Number of Terminations: 2; Resistance Tolerance: 1%; Construction: Rectangular; Technology: THICK FILM; Length: 1mm; Width: 0.5mm; Height: 0.35mm; Depth: 0.5mm; RoHS Compliant: Yes; REACH SVHC: Unknown; Military Standard: Not; Lead Free: Lead Free; ComponentLink1URL: https://datasheet.ciiva.com/11819/0900766b80c66297-11819487.pdf?src-supplier=RSComponents; ComponentLink1Description: https://datasheet.ciiva.com/11819/0900766b80c66297-11819487.pdf?src-supplier=RSComponents; ComponentLink2URL: https://datasheet.ciiva.com/24070/pyu-rc0402-51-rohs-l-6-r-8721-24070077.pdf?src-supplier=Mouser; ComponentLink2Description: https://datasheet.ciiva.com/24070/pyu-rc0402-51-rohs-l-6-r-8721-24070077.pdf?src-supplier=Mouser; ComponentLink3URL: https://datasheet.ciiva.com/7849/1018594-7849967.pdf?src-supplier=Element14; ComponentLink3Description: https://datasheet.ciiva.com/7849/1018594-7849967.pdf?src-supplier=Element14; ComponentLink4URL: https://datasheet.ciiva.com/7849/1018594-7849966.pdf?src-supplier=Element14; ComponentLink4Description: https://datasheet.ciiva.com/7849/1018594-7849966.pdf?src-supplier=Element14; ComponentLink5URL: https://datasheet.ciiva.com/15189/getdatasheetpartid-329253-15189431.pdf?src-supplier=Verical; ComponentLink5Description: https://datasheet.ciiva.com/15189/getdatasheetpartid-329253-15189431.pdf?src-supplier=Verical; ComponentLink6URL: https://datasheet.ciiva.com/17070/pyu-rc0402-51-rohs-l-6-r-17070335.pdf?src-supplier=Future+Electronics; ComponentLink6Description: https://datasheet.ciiva.com/17070/pyu-rc0402-51-rohs-l-6-r-17070335.pdf?src-supplier=Future+Electronics; Supplier Part Number 1: 603-RC0402FR-0733RL; LCSC Part Number: C138002
R?#70 R?#71 R?#74 R?#75 = RC0603FR-0722K1L: RES 22.1K OHM 1% 1/10W 0603; Manufacturer: Yageo; Power Rating: 100mW; Resistance: 22.1kR; Voltage Rating: 50V; Temperature Coefficient: 100ppm/°C; Item Type: Resistor; Supplier 1: Avnet; Manufacturer Part Number: RC0603FR-0722K1L; RoHS: Yes; Category: Chip SMD Resistors; Stock 1: 595000; Pricing 1: 5000=0.00133, 10000=0.00131, 20000=0.00127 (USD); Case/Package: 0603; Case Code (Imperial): 0603; Case Code (Metric): 1608; Size Code: 0603; Min Operating Temperature: -55°C; Max Operating Temperature: 155°C; Tolerance: 1%; Package Quantity: 5000; Packaging: Tape and Reel; Termination: SMD/SMT; Voltage Rating (DC): 50V; Series: RC; Length: 1.6mm; Width: 0.8mm; Height: 0.45mm; Lead Free: Lead Free; RoHS Compliant: Yes; ComponentLink1URL: https://datasheet.ciiva.com/12555/rc0603-272842-12555287.pdf?src-supplier=Mouser; ComponentLink1Description: https://datasheet.ciiva.com/12555/rc0603-272842-12555287.pdf?src-supplier=Mouser; Supplier Part Number 1: RC0603FR-0722K1L; LCSC Part Number: C137768
R?#72 R?#73 R?#76 R?#77 = RC0603FR-0747K5L: RES 47.5K OHM 1% 1/10W 0603; Manufacturer: Yageo; Resistance: 47.5kR; Power Rating: 100mW; Voltage Rating: 50V; Temperature Coefficient: 100ppm/°C; Item Type: Resistor; Supplier 1: Avnet; Manufacturer Part Number: RC0603FR-0747K5L; RoHS: Yes; Category: Chip SMD Resistors; Stock 1: 20000; Pricing 1: 5000=0.00133, 10000=0.00131, 20000=0.00127 (USD); Case/Package: 0603; Number of Pins: 2; Case Code (Metric): 1608; Case Code (Imperial): 0603; Size Code: 0603; Min Operating Temperature: -55°C; Max Operating Temperature: 155°C; Tolerance: 1%; Package Quantity: 5000; Packaging: Tape and Reel; Resistor Type: Thick Film; Number of Terminations: 2; Termination: SMD/SMT; Max Power Dissipation: 100mW; Voltage Rating (DC): 50V; Features: Moisture Resistant; Series: RC; Technology: THICK FILM; Construction: Rectangular; Resistance Tolerance: 1%; Length: 1.6mm; Width: 0.031inch; Height: 0.45mm; Depth: 0.8mm; RoHS Compliant: Yes; Reach SVHC Compliant: Yes; Military Standard: Not; Lead Free: Lead Free; ComponentLink1URL: https://datasheet.ciiva.com/11808/0900766b80f96399-11808343.pdf?src-supplier=RSComponents; ComponentLink1Description: https://datasheet.ciiva.com/11808/0900766b80f96399-11808343.pdf?src-supplier=RSComponents; ComponentLink2URL: https://datasheet.ciiva.com/2454/pyu-r-int-thick-7-2454790.pdf?src-supplier=Digi-Key; ComponentLink2Description: https://datasheet.ciiva.com/2454/pyu-r-int-thick-7-2454790.pdf?src-supplier=Digi-Key; ComponentLink3URL: https://datasheet.ciiva.com/2454/pyu-r-int-thick-7-2454791.pdf?src-supplier=Digi-Key; ComponentLink3Description: https://datasheet.ciiva.com/2454/pyu-r-int-thick-7-2454791.pdf?src-supplier=Digi-Key; ComponentLink4URL: https://datasheet.ciiva.com/2454/pyu-r-int-thick-7-2454789.pdf?src-supplier=Digi-Key; ComponentLink4Description: https://datasheet.ciiva.com/2454/pyu-r-int-thick-7-2454789.pdf?src-supplier=Digi-Key; ComponentLink5URL: https://datasheet.ciiva.com/12555/rc0603-272842-12555285.pdf?src-supplier=Mouser; ComponentLink5Description: https://datasheet.ciiva.com/12555/rc0603-272842-12555285.pdf?src-supplier=Mouser; ComponentLink6URL: https://datasheet.ciiva.com/15189/getdatasheetpartid-135115-15189741.pdf?src-supplier=Verical; ComponentLink6Description: https://datasheet.ciiva.com/15189/getdatasheetpartid-135115-15189741.pdf?src-supplier=Verical; Supplier Part Number 1: RC0603FR-0747K5L; LCSC Part Number: C137715
SB?#12 SB?#13 = Solder Bridge 0603: Solder Bridge ON; Manufacturer Part Number: Solder Bridge; Item Type: Solder Bridge
U?#13 = GL852G-HHG12: SSOP-28-208mil USB ICs ROHS; Manufacturer: Genesys Logic; Item Type: IC; Manufacturer Part Number: GL852G-HHG12; LCSC Part Number: C136618; Package: SSOP-28-208mil; ComponentLink1Description: LCSC; ComponentLink1URL: https://www.lcsc.com/product-detail/USB-ICs_Genesys-Logic-GL852G-HHG12_C136618.html
U?#14 = SY6280AAC: SOT-23-5 Power Distribution Switches ROHS; Manufacturer: Silergy Corp; Item Type: IC; Manufacturer Part Number: SY6280AAC; Package: SOT-23-5; LCSC Part Number: C55136; ComponentLink1Description: LCSC; ComponentLink1URL: https://www.lcsc.com/product-detail/Power-Distribution-Switches_Silergy-Corp-SY6280AAC_C55136.html
U?#15 U?#16 = CP2102N-A02-GQFN28R: IC USB TO UART BRIDGE QFN28; Manufacturer: Silicon Labs; Supplier 1: Digi-Key; Manufacturer Part Number: CP2102N-A02-GQFN28R; RoHS: Yes; Stock 1: 1242; Pricing 1: 1=1.47000 (USD); Supplier Part Number 1: 336-5890-1-ND; LCSC Part Number: C964632; Item Type: IC
U?#17 U?#18 = CP2102N-A02-GQFN20R: IC USB TO UART BRIDGE QFN20; Manufacturer: Silicon Labs; Supplier 1: Arrow Electronics; Manufacturer Part Number: CP2102N-A02-GQFN20R; RoHS: Yes; Category: Interface ICs; Stock 1: 1500; Pricing 1: 1500=2.30100, 3000=2.28500, 6000=2.26800, 12000=2.25200, 15000=2.23600, 24000=2.22000, 30000=2.20300 (USD); Supplier Part Number 1: CP2102N-A02-GQFN20R; ComponentLink1Description: LCSC; ComponentLink1URL: https://www.lcsc.com/product-detail/USB-ICs_SILICON-LABS-CP2102N-A02-GQFN20R_C969913.html; LCSC Part Number: C969913; Item Type: IC
X?#2 = X322512MOB4SI: 12MHz SMD Crystal Resonator 12pF ±10ppm ±30ppm -40℃~+85℃ SMD3225-4P Crystals ROHS; Manufacturer: Yangxing Tech; Manufacturer Part Number: X322512MOB4SI; ComponentLink1Description: LCSC; ComponentLink1URL: https://www.lcsc.com/product-detail/Crystals_Yangxing-Tech-X322512MOB4SI_C70565.html; Package: SMD3225-4P; LCSC Part Number: C70565; Item Type: Crystal

## Nets that join several sheets
GND: Power-Sheet-1 (77 pins), Power-Sheet-2 (69 pins), Power-Sheet-3 (70 pins), RK3588-Power (486 pins), RK3588-OSC-PLL-PMUIO (19 pins), RK3588-DDR-Controller (30 pins), RK3588-EMMC-SD (C276.2 C277.2 C278.2), RK3588-USB-Control (17 pins), RK3588-SARADC (10 pins), RK3588-HDMI (14 pins), RK3588-GPIO (5 pins), RK3588-USB-Ports (50 pins), RK3588-USB_HUB (45 pins), RK3588-LPDDR4 (202 pins), RK3588-EMMC-Flash-TF-Card (37 pins), RK3588-HDMI-Connector (47 pins), RK3588-eDP-Keys-Debug (40 pins), WiFi-Section (36 pins), ESP32-Sheet (18 pins), CCB-MB-Interface (52 pins)
VCC1V8_PMU_DDR_S3: Power-Sheet-3 (R52.1), RK3588-OSC-PLL-PMUIO (C236.1 C244.1 U10.N28 U10.R27), RK3588-LPDDR4 (34 pins), RK3588-EMMC-Flash-TF-Card (R171.2)
VCC3V3_LCD: Power-Sheet-2 (C240.2 U12.1), RK3588-eDP-Keys-Debug (6 pins)
VCC3V3_USBUART: RK3588-USB_HUB (13 pins), CCB-MB-Interface (25 pins)
VCC4V0_SYS: Power-Sheet-1 (10 pins), Power-Sheet-2 (20 pins), Power-Sheet-3 (28 pins)
VCC12V_DCIN: Power-Sheet-1 (14 pins), Power-Sheet-2 (F3.1), RK3588-eDP-Keys-Debug (C460.2 C463.1 Q23.2 R208.2)
VCC_1V1_NLDO_S3: Power-Sheet-2 (5 pins), Power-Sheet-3 (C152.2 C153.2 U9.9 U9.13)
VCC_1V8_S0: Power-Sheet-2 (R40.1), Power-Sheet-3 (C146.1 U9.58), RK3588-EMMC-SD (C277.1 U10.AA7), RK3588-SARADC (10 pins), RK3588-HDMI (10 pins), RK3588-GPIO (9 pins), RK3588-HDMI-Connector (R193.1 R194.1 R201.1 R202.1)
VCC_1V8_S3: Power-Sheet-2 (R33.1), Power-Sheet-3 (8 pins), RK3588-EMMC-SD (C276.1 U10.V26), RK3588-EMMC-Flash-TF-Card (16 pins), WiFi-Section (R215.1 R223.2)
VCC_3V3_S0: Power-Sheet-2 (C84.2 U11.1), RK3588-GPIO (6 pins), RK3588-USB_HUB (C?#6.1 R?#7.2 SB?#2.1 U?#3.16), RK3588-HDMI-Connector (10 pins), ESP32-Sheet (R?#36.2), CCB-MB-Interface (R?#46.2 SB?#12.1)
VCC_3V3_S3: Power-Sheet-2 (6 pins), Power-Sheet-3 (5 pins), RK3588-OSC-PLL-PMUIO (8 pins), RK3588-EMMC-Flash-TF-Card (9 pins), RK3588-eDP-Keys-Debug (P12.1), WiFi-Section (C477.1 C478.1 C479.1 R214.1)
VCC_5V0: Power-Sheet-1 (10 pins), RK3588-USB-Ports (7 pins), RK3588-USB_HUB (C?#4.1 U?#1.5), RK3588-HDMI-Connector (6 pins), CCB-MB-Interface (C?#28.1 J?#4.9 J?#5.9 U?#14.5)
VCCA_1V8_S0: Power-Sheet-3 (C145.1 U9.60), RK3588-OSC-PLL-PMUIO (U10.N27 U10.U18), RK3588-DDR-Controller (C268.1 C269.1 U10.K16 U10.M12), RK3588-USB-Control (8 pins), RK3588-SARADC (5 pins)
VCCA_3V3_S0: Power-Sheet-1 (R26.2), Power-Sheet-3 (C148.1 U9.63), RK3588-USB-Control (C289.1 U10.AJ10), RK3588-USB-Ports (R131.2)
VCCIO_SD_S0: Power-Sheet-3 (C149.1 U9.65), RK3588-EMMC-SD (C278.1 U10.Y7)
VDD2_DDR_S3: Power-Sheet-3 (7 pins), RK3588-LPDDR4 (84 pins)
VDD_0V75_S0: Power-Sheet-3 (C158.1 U9.8), RK3588-OSC-PLL-PMUIO (U10.V20), RK3588-SARADC (C297.1 U10.AD3)
VDD_0V75_S3: Power-Sheet-3 (C154.1 U9.14), RK3588-OSC-PLL-PMUIO (C237.1 C238.1 U10.P27)
VDD_CPU_BIG0_S0: Power-Sheet-2 (11 pins), RK3588-Power (23 pins)
VDD_CPU_BIG1_MEM_S0: Power-Sheet-2 (C206.2 FB1.2), RK3588-Power (C217.1 C218.1 U10.M21 U10.N21)
VDD_CPU_BIG1_S0: Power-Sheet-2 (12 pins), RK3588-Power (20 pins)
VDD_CPU_LIT_S0: Power-Sheet-3 (10 pins), RK3588-Power (19 pins)
VDD_DDR_S0: Power-Sheet-3 (9 pins), RK3588-DDR-Controller (22 pins)
VDD_GPU_S0: Power-Sheet-3 (10 pins), RK3588-Power (24 pins)
VDD_LOG_S0: Power-Sheet-3 (10 pins), RK3588-Power (19 pins)
VDD_NPU_S0: Power-Sheet-2 (11 pins), RK3588-Power (18 pins)
VDD_VDENC_S0: Power-Sheet-3 (10 pins), RK3588-Power (16 pins)
VDDA_0V75_S0: Power-Sheet-3 (C156.1 U9.11), RK3588-USB-Control (C287.1 U10.AH10), RK3588-HDMI (10 pins)
VDDA_0V85_S0: Power-Sheet-3 (C157.1 U9.10), RK3588-USB-Control (8 pins)
VDDA_DDR_PLL_S0: Power-Sheet-3 (C155.1 U9.12), RK3588-DDR-Controller (C258.1 C259.1 U10.L15 U10.N12)
VDDQ_DDR_CK_S0: RK3588-DDR-Controller (C266.1 C267.1 U10.L10 U10.M13), RK3588-LPDDR4 (R149.2)
VDDQ_DDR_CKE_S3: RK3588-DDR-Controller (C270.1 C271.1 U10.H13 U10.N8), RK3588-LPDDR4 (R150.2)
VDDQ_DDR_S0: Power-Sheet-3 (7 pins), RK3588-DDR-Controller (26 pins), RK3588-LPDDR4 (R149.1)